# Altium schematic sheet ProyectoPuenteH.SchDoc
size A4; SheetNumber: 1; SheetTotal: 1
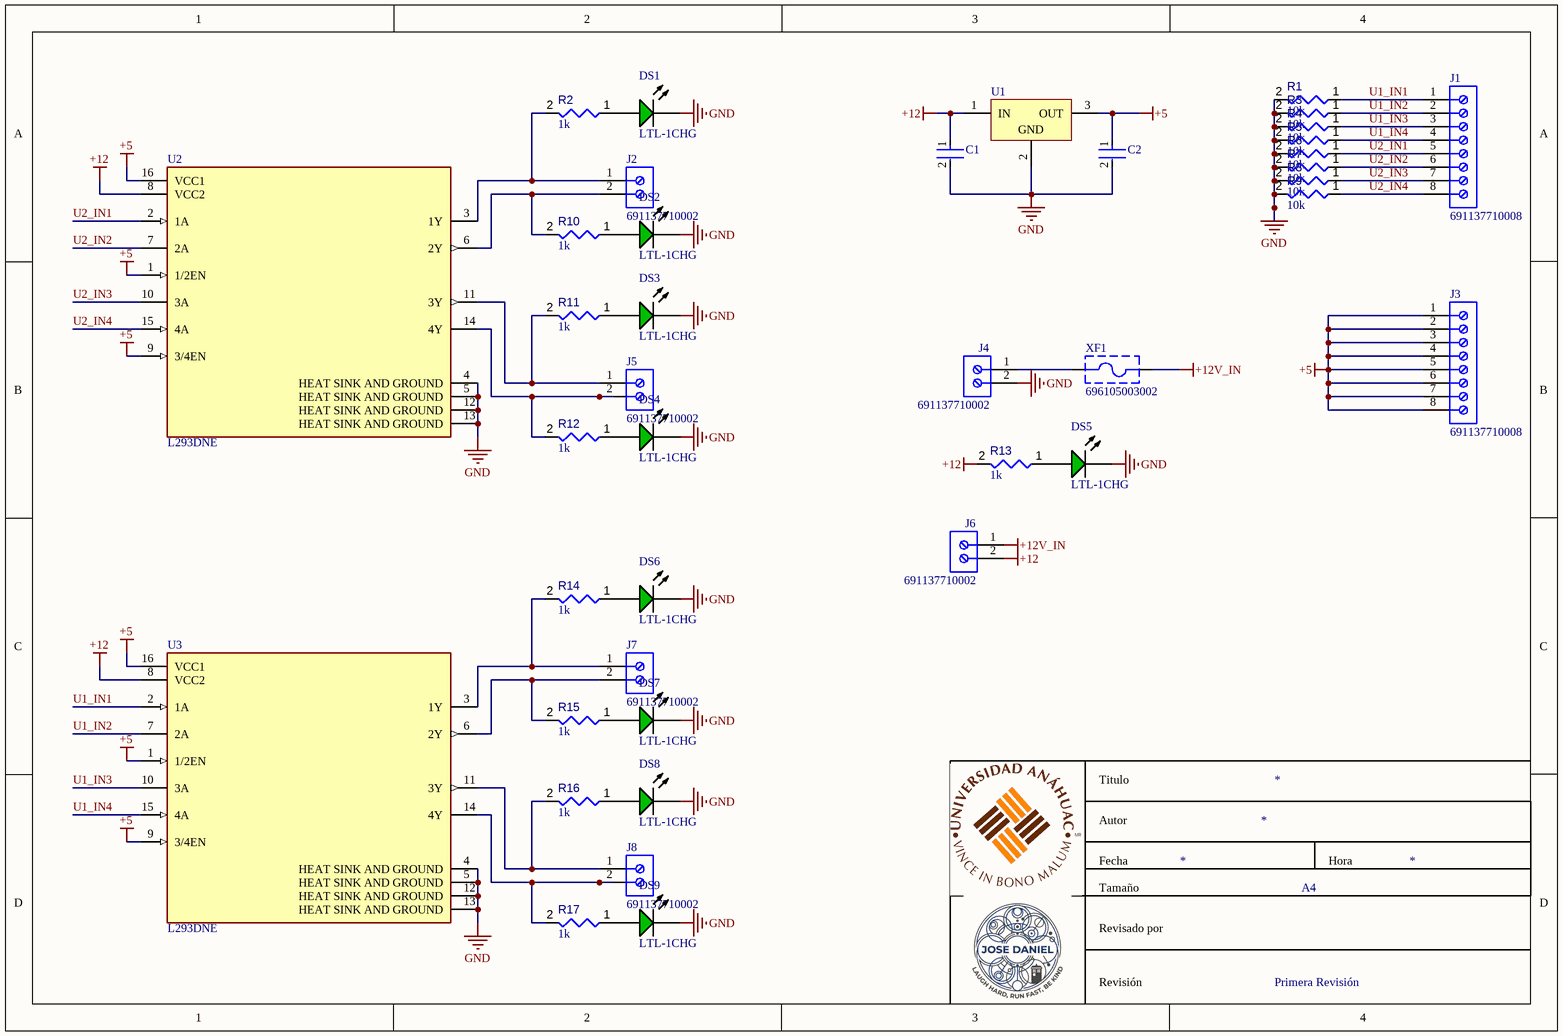
[diagram p0: ProyectoPuenteH.SchDoc]

## Parts
C1  C322C104K5R5TA  [FP-C322C104K5R5TA-MFG]  (value not drawn)
C2  C322C104K5R5TA  [FP-C322C104K5R5TA-MFG]  (value not drawn)
DS1  LTL-1CHG  [LTST-LTL-1CHG-2]
DS2  LTL-1CHG  [LTST-LTL-1CHG-2]
DS3  LTL-1CHG  [LTST-LTL-1CHG-2]
DS4  LTL-1CHG  [LTST-LTL-1CHG-2]
DS5  LTL-1CHG  [LTST-LTL-1CHG-2]
DS6  LTL-1CHG  [LTST-LTL-1CHG-2]
DS7  LTL-1CHG  [LTST-LTL-1CHG-2]
DS8  LTL-1CHG  [LTST-LTL-1CHG-2]
DS9  LTL-1CHG  [LTST-LTL-1CHG-2]
J1  691137710008  [691137710008]
J2  691137710002  [691137710002]
J3  691137710008  [691137710008]
J4  691137710002  [691137710002]
J5  691137710002  [691137710002]
J6  691137710002  [691137710002]
J7  691137710002  [691137710002]
J8  691137710002  [691137710002]
R1  value 10k  [RESA60-630X240]  (hidden comment: MFR-25FBF52-100K)
R2  value 1k  [RESA60-630X240]  (hidden comment: MFR-25FBF52-100K)
R3  value 10k  [RESA60-630X240]  (hidden comment: MFR-25FBF52-100K)
R4  value 10k  [RESA60-630X240]  (hidden comment: MFR-25FBF52-100K)
R5  value 10k  [RESA60-630X240]  (hidden comment: MFR-25FBF52-100K)
R6  value 10k  [RESA60-630X240]  (hidden comment: MFR-25FBF52-100K)
R7  value 10k  [RESA60-630X240]  (hidden comment: MFR-25FBF52-100K)
R8  value 10k  [RESA60-630X240]  (hidden comment: MFR-25FBF52-100K)
R9  value 10k  [RESA60-630X240]  (hidden comment: MFR-25FBF52-100K)
R10  value 1k  [RESA60-630X240]  (hidden comment: MFR-25FBF52-100K)
R11  value 1k  [RESA60-630X240]  (hidden comment: MFR-25FBF52-100K)
R12  value 1k  [RESA60-630X240]  (hidden comment: MFR-25FBF52-100K)
R13  value 1k  [RESA60-630X240]  (hidden comment: MFR-25FBF52-100K)
R14  value 1k  [RESA60-630X240]  (hidden comment: MFR-25FBF52-100K)
R15  value 1k  [RESA60-630X240]  (hidden comment: MFR-25FBF52-100K)
R16  value 1k  [RESA60-630X240]  (hidden comment: MFR-25FBF52-100K)
R17  value 1k  [RESA60-630X240]  (hidden comment: MFR-25FBF52-100K)
U1  L7805CV  [TO220]  (value not drawn)
U2  L293DNE  [FP-NE0016A-MFG]
U3  L293DNE  [FP-NE0016A-MFG]
XF1  696105003002  [696105003002]

## Nets
+5: C2.1 J3.1 J3.2 J3.3 J3.4 J3.5 J3.6 J3.7 J3.8 U1.3(OUT) U2.1(1/2EN) U2.9(3/4EN) U2.16(VCC1) U3.1(1/2EN) U3.9(3/4EN) U3.16(VCC1)
+12: C1.1 J6.2 R13.2 U1.1(IN) U2.8(VCC2) U3.8(VCC2)
+12V_IN: J6.1 XF1.2
GND: C1.2 C2.2 DS1.2(K) DS2.2(K) DS3.2(K) DS4.2(K) DS5.2(K) DS6.2(K) DS7.2(K) DS8.2(K) DS9.2(K) J4.2 R1.2 R3.2 R4.2 R5.2 R6.2 R7.2 R8.2 R9.2 U1.2(GND) U2.4(HEAT_SINK_AND_GROUND) U2.5(HEAT_SINK_AND_GROUND) U2.12(HEAT_SINK_AND_GROUND) U2.13(HEAT_SINK_AND_GROUND) U3.4(HEAT_SINK_AND_GROUND) U3.5(HEAT_SINK_AND_GROUND) U3.12(HEAT_SINK_AND_GROUND) U3.13(HEAT_SINK_AND_GROUND)
U1_IN1: J1.1 R1.1 U3.2(1A)
U1_IN2: J1.2 R3.1 U3.7(2A)
U1_IN3: J1.3 R4.1 U3.10(3A)
U1_IN4: J1.4 R5.1 U3.15(4A)
U2_IN1: J1.5 R6.1 U2.2(1A)
U2_IN2: J1.6 R7.1 U2.7(2A)
U2_IN3: J1.7 R8.1 U2.10(3A)
U2_IN4: J1.8 R9.1 U2.15(4A)
NetDS1_1: DS1.1(A) R2.1
NetDS2_1: DS2.1(A) R10.1
NetDS3_1: DS3.1(A) R11.1
NetDS4_1: DS4.1(A) R12.1
NetDS5_1: DS5.1(A) R13.1
NetDS6_1: DS6.1(A) R14.1
NetDS7_1: DS7.1(A) R15.1
NetDS8_1: DS8.1(A) R16.1
NetDS9_1: DS9.1(A) R17.1
NetJ2_1: J2.1 R2.2 U2.3(1Y)
NetJ2_2: J2.2 R10.2 U2.6(2Y)
NetJ4_1: J4.1 XF1.1
NetJ5_1: J5.1 R11.2 U2.11(3Y)
NetJ5_2: J5.2 R12.2 U2.14(4Y)
NetJ7_1: J7.1 R14.2 U3.3(1Y)
NetJ7_2: J7.2 R15.2 U3.6(2Y)
NetJ8_1: J8.1 R16.2 U3.11(3Y)
NetJ8_2: J8.2 R17.2 U3.14(4Y)

## Notes on the sheet
- Titulo
- Autor
- Fecha
- Tamaño
- A4
- Hora
- Revisado por
- Revisión
- Primera Revisión

## Library data of the parts
C1 C2 = CMP-03020-034661-1: CAP CER 0.1UF 50V X7R RADIAL; Capacitance: 100nF; Dielectric Material: Ceramic; Dissipation Factor: 2.5%; Lead Length: 7mm; Tolerance: 10%; Lead Diameter: 0.51mm; Lead/Base Style: Formed Leads; Construction: RADIAL; RoHS Compliant: Yes; Voltage Rating (DC): 50V; Packaging: Bulk; Lead Free: Lead Free; Width: 0.125inch; Lead Pitch: 5.08mm; Voltage Rating: 50V; Number of Pins: 2; Radiation Hardening: No; Material: Ceramic; REACH SVHC: No SVHC; Height - Seated (Max): 0.26inch; Case/Package: Radial; Weight: 0.0625lb; Dielectric: X7R; Min Operating Temperature: -55°C; Voltage: 50V; Series: Golden Max™; Max Operating Temperature: 125°C; Height: 3.18mm; Termination: Radial; Length: 5.08mm; Depth: 3.18mm; Package Quantity: 500; Mount: Through Hole
DS1-DS9 = CMP-007-00019-2: LED Uni-Color Green, 100 mW, 30 mA, -55 to 100 degC, 2-Pin THD, RoHS, Bulk; Manufacturer: Lite-On; Power: 100mW; Forward Voltage: 2.6V; Forward Current: 30mA; Nominal Vf: 2.1V; Lens Style: Dome; Viewing Angle: 60degrees; Luminous Intensity: 12.6mcd; Max Operating Temperature: 100°C; Case/Package: Radial; Package Reference: LTL-1CHG; Manufacturer URL: http://www.us.liteon.com/; Package Quantity: 1000; Colour: Green; Packaging: Bulk; RoHS Compliant: True; Datasheet URL: http://datasheet.octopart.com/LTL-1CHG-Lite-On-datasheet-143841.pdf; Package Description: 2-Pin Through Hole Device, Dia 3.8 mm; Min Operating Temperature: -55°C; Mounting Technology: TH; Pins: 2; Illumination Colour: Green; Datasheet Version: Mar-00
J1 J3 = CMP-1502-03330-3: Terminal Block, 5MM Pitch, Horizontal, Pressure Clamp Glow Wire, Pcb, 8PINS, Gr; Number of Contacts: 8; Current Rating: 16A; Voltage Rating: 300V; Number of Rows: 1; Number of Pins: 8; Lead Pitch: 5mm; Min Operating Temperature: -30°C; Max Operating Temperature: 110°C; Contact Material: Tin; Height: 11.6mm; RoHS: Compliant; Packaging: Box
J2 J4-J8 = CMP-1502-03324-3: Terminal Block, 5MM Pitch, Horizontal, Pressure Clamp Glow Wire, Pcb, 2PINS, Gr; Current Rating: 16A; Number of Contacts: 2; Voltage Rating: 300V; Number of Pins: 2; Min Operating Temperature: -30°C; Lead Pitch: 5mm; Packaging: Box; Max Operating Temperature: 120°C; RoHS: Compliant; Number of Rows: 1; Height: 11.6mm; Contact Material: Nickel, Tin
R1-R17 = CMP-009-00045-4: Axial Resistor, 100 KOhm, +/- 1%, 0.25 W, -55 to 155 degC, 2-Pin THD, RoHS, Bulk; Manufacturer: Yageo; Power: 250mW; Voltage Rating: 250V; Case/Package: Axial; Max Operating Temperature: 155°C; Package Reference: MFR-25; Package Quantity: 200; Package Description: 2-Pin Axial Lead, Dia 2.4 mm, Body Length 6.3 mm; Tolerance: 1%; Manufacturer URL: http://www.yageo.com/; Packaging: Bulk; Mounting Technology: TH; Min Operating Temperature: -55°C; RoHS Compliant: True; Datasheet Version: Apr-13; Datasheet URL: http://www.yageo.com/documents/recent/Yageo%20LR_MFR_2013.pdf
U1 = CMP-0244-00483-1: Positive Voltage Regulator, 5V, 3-Pin TO-220; PackageDescription: TO, Thru-Hole, Vertical, Heatsink Mounted; 3 In-Line Leads; Pitch 2.54 mm; ComponentLink2Description: Datasheet; PackageReference: TO220; ComponentLink3URL: http://www.st.com/internet/com/TECHNICAL_RESOURCES/TECHNICAL_LITERATURE/PACKAGE_INFORMATION/CD00004649.pdf; DatasheetVersion: 16/11/2011; ComponentLink1Description: Manufacturer URL; ComponentLink1URL: http://www.st.com; PackageVersion: ver3.0; ComponentLink3Description: Package Specification; ComponentLink2URL: http://www.st.com/internet/com/TECHNICAL_RESOURCES/TECHNICAL_LITERATURE/DATASHEET/CD00000444.pdf
U2 U3 = CMP-1685-00015-2: IC MTR DRV BIPOLAR 4.5-36V 16DIP; Number of Drivers: 4; Logic Function: AND GATE; Output Voltage: 36V; Operating Supply Current: 24mA; Interface: Parallel; Min Supply Voltage: 4.5V; Output Current: 600mA; Weight: 0.03357oz; Packaging: Rail/Tube; Length: 19.8mm; Case/Package: PDIP; REACH SVHC: No SVHC; Width: 6.35mm; Min Operating Temperature: 0°C; Max Operating Temperature: 70°C; Height: 4.57mm; Radiation Hardening: No; Mount: Through Hole; Package Quantity: 25; Number of Outputs: 4; Number of Pins: 16; Max Supply Voltage: 36V; Lead Free: Lead Free
XF1 = CMP-1502-00234-3: WR-FSH Fuse Holder Blocks Fuse Holder Blocks Clip Cover for PCB; Voltage Rating (AC): 250V; Fuse Current: 10A; REACH SVHC: Unknown; Packaging: Box; Mount: Through Hole